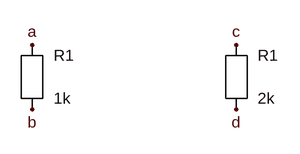
[diagram p0: schematic shared_reference.asc]
shared_reference.asc, the LTspice schematic file:
Version 4
SHEET 1 880 680
FLAG 96 48 a
FLAG 96 144 b
FLAG 400 48 c
FLAG 400 144 d
SYMBOL res 96 96 R0
SYMATTR InstName R1
SYMATTR Value 1k
SYMBOL res 400 96 R0
SYMATTR InstName R1
SYMATTR Value 2k

The netlist it stands for:
* shared_reference.asc
R1 a b 1k
R1 c d 2k
.backanno
.end